# EAGLE design ULA_Replacement (EAGLE 9.7.0)
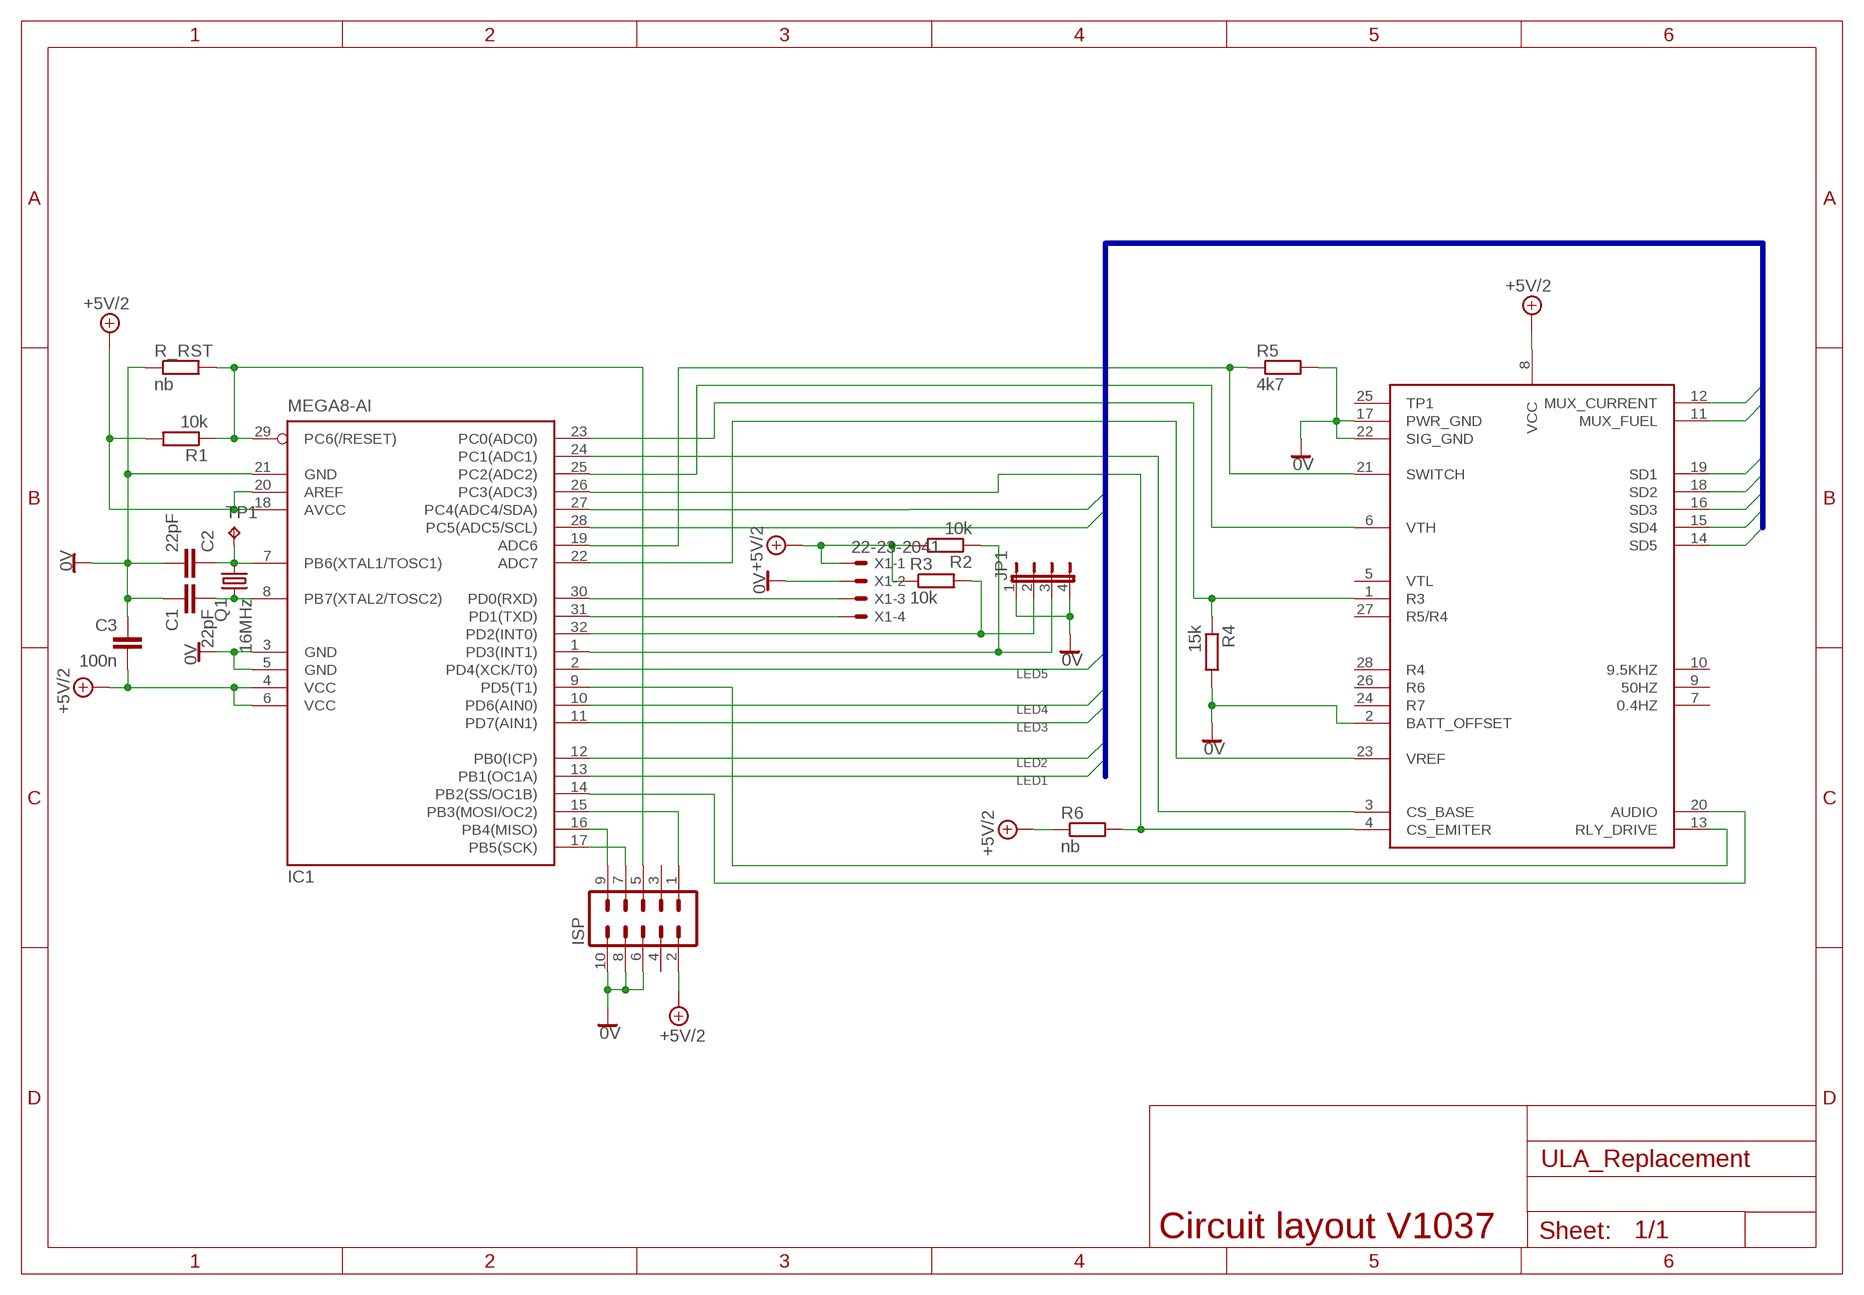
[diagram p0: schematic, sheet 1]

## Parts
C1  22pF  C-EUC0805  [C0805]
C2  22pF  C-EUC0805  [C0805]
C3  100n  C-EUC0805  [C0805]
IC1  MEGA8-AI  [TQFP32-08]
ISP  ML10  [ML10]
JP1  JP4E  [JP4]
Q1  16MHz  CRYSTALHC49S  [HC49/S]
R1  10k  R-EU_M0805  [M0805]
R2  10k  R-EU_M0805  [M0805]
R3  10k  R-EU_M0805  [M0805]
R4  15k  R-EU_M0805  [M0805]
R5  4k7  R-EU_M0805  [M0805]
R6  nb  R-EU_M0805  [M0805]
R_RST  nb  R-EU_0204/2V  [0204V]
TP1  TPB1,27  [B1,27]
U$1  C5_ULA  [C5_ULA]
X1  22-23-2041  [22-23-2041]

## Nets
+5V/2: C3.2 IC1.4(VCC) IC1.6(VCC) IC1.18(AVCC) IC1.20(AREF) ISP.2 R1.2 R2.2 R3.1 R6.1 U$1.8(VCC) X1.1
/RESET: IC1.29(PC6(/RESET)) ISP.5 R1.1 R_RST.2
AUDIO: IC1.14(PB2(SS/OC1B)) U$1.20(AUDIO)
CS_BASE: IC1.24(PC1(ADC1)) U$1.3(CS_BASE)
CS_EMITER: IC1.26(PC3(ADC3)) R6.2 U$1.4(CS_EMITER)
GND: C1.1 C2.2 C3.1 IC1.3(GND) IC1.5(GND) IC1.21(GND) ISP.6 ISP.8 ISP.10 JP1.1 JP1.4 R4.2 R5.2 R_RST.1 U$1.2(BATT_OFFSET) U$1.17(PWR_GND) U$1.22(SIG_GND) X1.2 ; supply symbol labelled 0V
INT0: IC1.32(PD2(INT0)) JP1.2 R3.2
INT1: IC1.1(PD3(INT1)) JP1.3 R2.1
LED1: IC1.13(PB1(OC1A)) U$1.19(SD1)
LED2: IC1.12(PB0(ICP)) U$1.18(SD2)
LED3: IC1.11(PD7(AIN1)) U$1.16(SD3)
LED4: IC1.10(PD6(AIN0)) U$1.15(SD4)
LED5: IC1.2(PD4(XCK/T0)) U$1.14(SD5)
MISO: IC1.16(PB4(MISO)) ISP.9
MOSI: IC1.15(PB3(MOSI/OC2)) ISP.1
MX_CURRENT: IC1.28(PC5(ADC5/SCL)) U$1.12(MUX_CURRENT)
MX_FUEL: IC1.27(PC4(ADC4/SDA)) U$1.11(MUX_FUEL)
R3: IC1.23(PC0(ADC0)) R4.1 U$1.1(R3)
RLY_DRIVE: IC1.9(PD5(T1)) U$1.13(RLY_DRIVE)
RXD: IC1.30(PD0(RXD)) X1.3
SCK: IC1.17(PB5(SCK)) ISP.7
SWITCH: IC1.19(ADC6) R5.1 U$1.21(SWITCH)
TXD: IC1.31(PD1(TXD)) X1.4
VREF: IC1.22(ADC7) U$1.23(VREF)
VTH: IC1.25(PC2(ADC2)) U$1.6(VTH)
XTAL1: C2.1 IC1.7(PB6(XTAL1/TOSC1)) Q1.1 TP1.TP
XTAL2: C1.2 IC1.8(PB7(XTAL2/TOSC2)) Q1.2
Unconnected: ISP.3 ISP.4 U$1.5(VTL) U$1.7(0.4HZ) U$1.9(50HZ) U$1.10(9.5KHZ) U$1.24(R7) U$1.25(TP1) U$1.26(R6) U$1.27(R5/R4) U$1.28(R4)

## Buses
MX_FUEL,MX_CURRENT,LED1,LED2,LED3,LED4,LED5

## Notes on the sheet
- Circuit layout V1037

## Library data of the parts
C1-C3 = rcl:C-EU: CAPACITOR, European symbol
IC1 = atmel:MEGA8: MICROCONTROLLER 8 Kbytes FLASH, 1 kbytes SRAM, 512 bytes EEPROM, USART, 6-channel 10 bit ADC, 2-channel 8 bit ADC Pin compatible with Atmega48, ATMega88, ATMega168 Source: avr.lbr
ISP = con-harting-ml:ML10: HARTING
JP1 = jumper:JP4E: JUMPER
Q1 = crystal:CRYSTAL: CRYSTAL
R1-R6 R_RST = rcl:R-EU_: RESISTOR, European symbol
TP1 = testpad:TP: Test pad
U$1 = c5_ula:C5_ULA: Sinclair C5 ULA chip
X1 = con-molex:22-23-2041: .100" (2.54mm) Center Header - 4 Pin

## Board
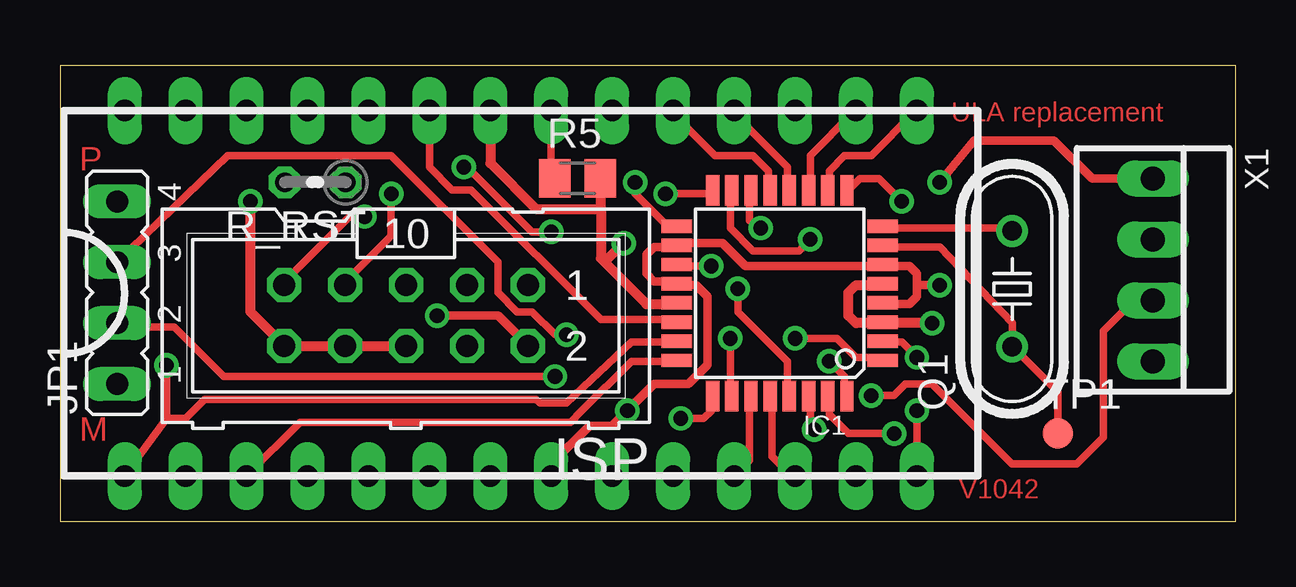
[diagram p1: board, top side]
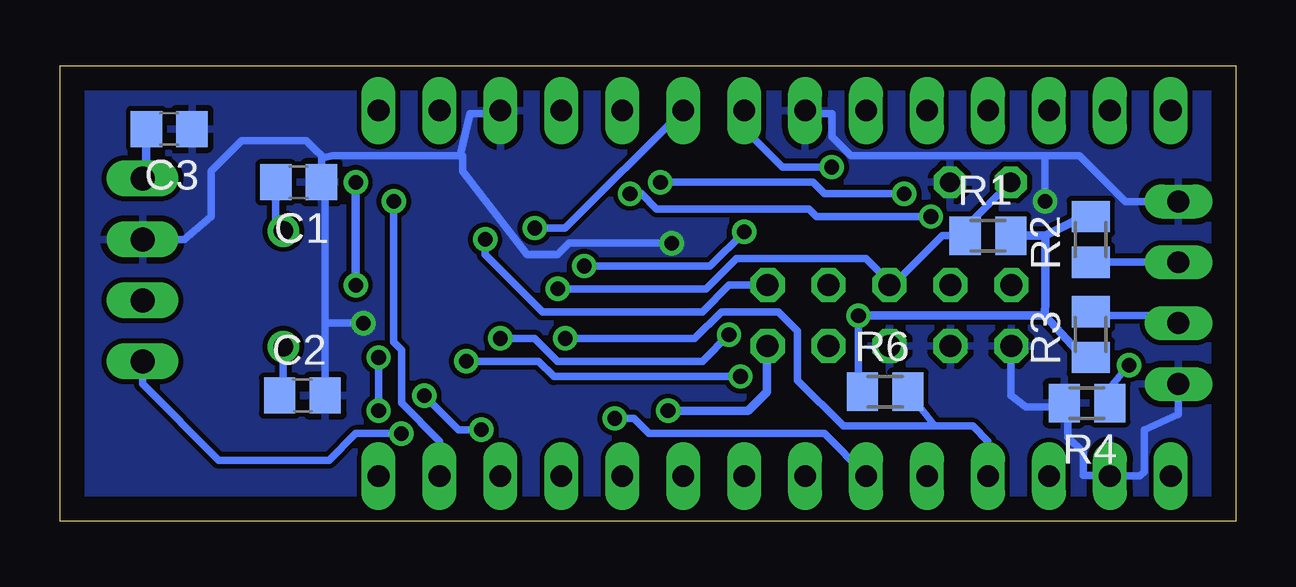
[diagram p2: board, bottom side, seen from below]

Size 49 x 19 mm. Coordinates in mm from the lower left corner, seen from the top.
Outline: 49,0 49,19 0,19 0,0 49,0
Copper layers (1*16): Top 0.035mm / dielectric 1.5mm / Bottom 0.035mm
Design rules "Fusion Electronics Design Rules": minimum track width 12mil, minimum drill 24mil, track to track 8mil, track to pad 8mil, pad to pad 8mil, via to via 8mil, smd to smd 8mil, copper to edge 40mil, drill to drill 8mil, minimum pad ring 10mil, minimum via ring 8mil, stop-mask expansion 4mil, vias tented up to drill 0mil, thermal gap 10mil

### Footprints (pad centres in the part's own frame; a part is rotated, then mirrored left to right if it is on the bottom)
C0805 = smd 1.3 x 1.5: 1 -0.95,0; 2 0.95,0
TQFP32-08 = smd 1.27 x 0.559: 1 -4.293,2.8; 2 -4.293,2; 3 -4.293,1.2; 4 -4.293,0.4; 5 -4.293,-0.4; 6 -4.293,-1.2; 7 -4.293,-2; 8 -4.293,-2.8; 17 4.293,-2.8; 18 4.293,-2; 19 4.293,-1.2; 20 4.293,-0.4; 21 4.293,0.4; 22 4.293,1.2; 23 4.293,2; 24 4.293,2.8 | smd 0.559 x 1.27: 9 -2.8,-4.293; 10 -2,-4.293; 11 -1.2,-4.293; 12 -0.4,-4.293; 13 0.4,-4.293; 14 1.2,-4.293; 15 2,-4.293; 16 2.8,-4.293; 25 2.8,4.293; 26 2,4.293; 27 1.2,4.293; 28 0.4,4.293; 29 -0.4,4.293; 30 -1.2,4.293; 31 -2,4.293; 32 -2.8,4.293
ML10 = drill 0.914 octagon: 1 -5.08,-1.27; 2 -5.08,1.27; 3 -2.54,-1.27; 4 -2.54,1.27; 5 0,-1.27; 6 0,1.27; 7 2.54,-1.27; 8 2.54,1.27; 9 5.08,-1.27; 10 5.08,1.27
JP4 = drill 0.914 long: 1 -3.81,0; 2 -1.27,0; 3 1.27,0; 4 3.81,0
HC49/S = drill 0.813: 1 -2.413,0; 2 2.413,0
M0805 = smd 1.3 x 1.6: 1 -0.95,0; 2 0.95,0
0204V = drill 0.813 octagon: 1 -1.27,0; 2 1.27,0
B1,27 = smd 1.27 x 1.27: TP 0,0
C5_ULA = drill 0.9 long: 1 -7.62,16.51; 2 -7.62,13.97; 3 -7.62,11.43; 4 -7.62,8.89; 5 -7.62,6.35; 6 -7.62,3.81; 7 -7.62,1.27; 8 -7.62,-1.27; 9 -7.62,-3.81; 10 -7.62,-6.35; 11 -7.62,-8.89; 12 -7.62,-11.43; 13 -7.62,-13.97; 14 -7.62,-16.51; 15 7.62,-16.51; 16 7.62,-13.97; 17 7.62,-11.43; 18 7.62,-8.89; 19 7.62,-6.35; 20 7.62,-3.81; 21 7.62,-1.27; 22 7.62,1.27; 23 7.62,3.81; 24 7.62,6.35; 25 7.62,8.89; 26 7.62,11.43; 27 7.62,13.97; 28 7.62,16.51
22-23-2041 = drill 1 long: 1 -3.81,0; 2 -1.27,0; 3 1.27,0; 4 3.81,0

### Placement (x,y rotation side)
C1  39.05,14.13 180 bottom
C2  38.89,5.24 0 bottom
C3  44.45,16.35 180 bottom
IC1  30,9.5 180 top
ISP  14.42,8.57 180 top
JP1  2.38,9.53 90 top
Q1  39.69,9.68 90 top
R1  10.32,11.91 0 bottom
R2  6.03,11.75 90 bottom
R3  6.03,7.78 90 bottom
R4  6.19,4.92 180 bottom
R5  21.57,14.29 0 top
R6  14.6,5.4 0 bottom
R_RST  10.64,14.13 180 top
TP1  41.59,3.65 0 top
U$1  19.21,9.5 90 top
X1  45.56,10.48 270 top

### Tracks (layer width: path | path; a pad name or v marks a point on that pad's centre or on a via)
+5V/2  (via drill 0.61)
  Top 0.305: 34.45,9.05 IC1.4 | 34.45,10.64 IC1.6 34.29,10.64 | 25.56,10 IC1.20 25.72,9.84 | 25.56,11.43 IC1.18 25.72,11.59 | v23.65,4.6 23.57,4.52 | X1.1
  Top 0.356: 34.45,9.05 35.4,9.05 35.72,9.37 35.72,9.84 | 35.72,9.84 35.72,10.32 35.4,10.64 34.45,10.64 | 25.56,10 24.77,10 24.45,10.32 24.45,11.11 24.77,11.43 25.56,11.43 | 34.29,10.64 28.57,10.64 27.62,11.59 25.72,11.59 | 25.72,9.84 26.51,9.84 26.99,9.37 26.99,6.82 26.99,6.51 26.2,5.72 26.04,5.71 24.77,5.71 23.57,4.52 23.02,3.97 22.07,3.97 20.48,2.38 U$1.8 | v36.67,14.13 38.1,15.88 41.27,15.88 41.43,15.88 43.02,14.29 45.4,14.29 X1.1 | 35.72,9.84 v36.67,9.84 | v15.72,8.57 18.26,8.57 19.37,7.46 ISP.2
  Bottom 0.305: 6.19,6.99 R3.1 6.25,6.86 6.4,6.86 6.35,6.83 | R1.2 | 6.67,12.54 6.19,12.54 R2.2 | R6.1 15.72,5.56 v15.72,8.57
  Bottom 0.356: R1.2 8.97,11.99 8.89,11.91 7.94,11.91 | 19.53,7.3 19.53,5.4 20.32,4.6 v23.65,4.6 | v36.67,9.84 v36.67,14.13 | 7.94,8.57 v15.72,8.57 | 6.35,6.83 7.94,8.57 | 7.94,11.91 6.67,12.54 | 7.94,11.91 7.94,9.21 7.94,8.57 | X1.1 45.4,14.61 45.4,15.72 C3.2
  Bottom 0.406: ISP.2 19.53,7.3
/RESET  (via drill 0.61)
  Top 0.305: v28.26,9.68 28.26,8.73 30.32,6.67 30.32,5.24 IC1.29
  Bottom 0.305: v28.26,9.68 22.07,9.68 20.8,10.95 15.4,10.95 14.45,10 ISP.5 14.29,9.84 12.22,11.91 R1.1 11.27,12.22 R_RST.2
  Bottom 0.406: R1.1 11.27,12.23
AUDIO  (via drill 0.61)
  Top 0.305: v29.21,12.22 28.73,12.54 28.73,13.65 IC1.14
  Bottom 0.305: v29.21,12.22 27.94,12.22 23.02,17.14 U$1.20
CS_BASE
  Top 0.305: 21.75,4.6 23.81,6.67 25.56,6.67 IC1.24 | 21.75,4.6 | 21.75,4.6 21.27,4.13 10,4.13 7.78,1.91 U$1.3
CS_EMITER  (via drill 0.61)
  Top 0.305: v27.94,7.62 27.94,5.24 IC1.26
  Bottom 0.305: v27.94,7.62 22.54,7.62 21.43,8.73 19.05,8.73 18.26,7.94 18.26,5.87 16.35,3.97 12.54,3.97 | 12.54,3.97 10.95,3.97 10.32,3.33 10.32,2.38 10.64,1.91 10.32,1.91 U$1.4 | 12.54,3.97 R6.2
GND  (via drill 0.61)
  Top 0.305: 34.29,8.26 IC1.3 34.45,8.26 | 34.29,9.84 IC1.5 | 9.37,7.3 ISP.10 9.21,7.46 | 11.75,7.3 ISP.8 11.91,7.3 | 14.29,7.3 ISP.6 | 22.54,14.13 R5.2 | 9.21,7.46 | IC1.21 25.56,9.21 25.56,9.05
  Top 0.406: 34.29,8.26 33.18,8.26 32.86,8.57 32.86,9.53 33.18,9.84 34.29,9.84 | v36.35,8.26 34.45,8.26 | 9.37,7.3 11.75,7.3 | 11.91,7.3 14.29,7.3 | 25.56,9.05 24.45,9.05 22.7,10.79 | 22.7,10.79 22.54,10.95 22.54,13.02 | 22.54,13.02 22.54,14.13 | 22.54,13.02 19.84,13.02 17.94,14.92 U$1.22 | 9.21,7.46 7.94,8.73 v7.94,13.34 | 22.7,10.79 v23.5,11.59
  Bottom 0.305: 38.26,14.29 37.94,14.45 38.1,14.61 38.1,15.16 38.02,15.16 | 38.26,14.29 38.1,14.29 C1.1 | 38.02,15.16 37.62,15.24 32.38,15.24 32.31,15.32 | 32.31,15.32 31.91,16.99 30.64,16.99 U$1.17 | 38.26,14.29 37.94,13.65 37.94,8.26 | 37.94,8.26 37.94,6.83 37.94,5.71 C2.2 | 37.94,8.26 v36.35,8.26 | 45.72,11.75 43.81,11.75 42.7,12.7 42.7,14.61 41.43,15.88 38.73,15.88 38.42,15.56 38.02,15.16 | 38.02,15.16 | JP1.1 2.38,4.45 3.81,3.81 3.81,2.06 3.99,1.88 U$1.2 5.24,1.91 6.35,1.91 6.35,2.86 6.99,3.49 6.99,3.65 6.99,4.6 R4.2 7.14,4.76 8.73,4.76 9.37,5.24 9.37,7.3 ISP.10 | JP1.4 4.6,13.34 6.51,15.24 7.94,15.24 | 7.94,15.24 16.03,15.24 16.83,16.03 16.83,16.99 17.78,16.99 U$1.22 | v7.94,13.34 7.94,15.24 | v23.5,11.59 27.78,11.59 28.26,11.11 29.53,11.11 32.23,14.61 32.23,15.24 32.31,15.32
  pour Bottom: 0.64,0.64 48.26,0.64 48.26,18.41 0.64,18.41
INT0  (via drill 0.61)
  Top 0.305: v32.07,6.67 32.7,6.03 32.7,5.24 IC1.32 | v20.64,6.03 6.83,6.03 4.76,8.1 2.38,8.1 JP1.2
  Bottom 0.305: v32.07,6.67 29.05,6.67 28.42,6.03 v20.64,6.03 | JP1.2 2.7,8.57 6.03,8.57 R3.2
INT1  (via drill 0.61)
  Top 0.305: v30.64,7.62 32.38,7.62 33.18,6.83 34.29,6.83 IC1.1 | v21.11,7.78 20.64,7.78 19.68,8.73 19.05,8.73 18.26,9.53 18.26,10.79 13.81,15.24 6.99,15.24 JP1.3
  Bottom 0.305: v30.64,7.62 29.21,7.62 28.26,6.67 22.23,6.67 v21.11,7.78 | JP1.3 R2.1
LED1
  Top 0.305: IC1.13 29.53,13.81 29.53,14.61 28.89,15.24 27.3,15.24 25.56,16.99 U$1.19
LED2
  Top 0.305: IC1.12 30.32,13.81 30.32,14.76 28.1,16.99 U$1.18
LED3
  Top 0.305: IC1.11 31.27,13.81 31.27,15.24 33.02,16.99 U$1.16
LED4
  Top 0.305: IC1.10 32.07,13.81 32.07,14.61 32.7,15.24 33.81,15.24 35.56,16.99 U$1.15
LED5  (via drill 0.61)
  Top 0.305: v35.72,6.83 35.08,7.46 34.45,7.46 IC1.2 | U$1.14 v35.72,4.6
  Bottom 0.305: v35.72,4.6 v35.72,6.83
MISO  (via drill 0.61)
  Top 0.305: v25.24,13.65 27.15,13.65 IC1.16 | v12.7,12.7 12.06,12.7 9.37,10 ISP.9
  Bottom 0.305: v25.24,13.65 24.77,13.65 24.13,13.02 17.78,13.02 17.46,12.7 v12.7,12.7
MOSI  (via drill 0.61)
  Top 0.305: v31.27,11.75 30.8,11.27 28.89,11.27 27.94,12.22 27.94,12.54 27.94,12.86 27.94,13.65 IC1.15
  Bottom 0.305: v31.27,11.75 31.27,11.11 28.89,8.73 22.23,8.73 21.11,9.84 19.53,9.84 ISP.1
MX_CURRENT
  Top 0.305: IC1.28 29.69,5.08 29.69,2.7 30.48,1.91 U$1.12
MX_FUEL
  Top 0.305: IC1.27 28.73,5.08 28.73,2.54 28.1,1.91 U$1.11
R3  (via drill 0.61)
  Top 0.305: 4.45,4.29 5.24,4.29 6.03,5.08 19.84,5.08 20,4.92 21.11,4.92 23.81,7.46 25.56,7.46 IC1.23 | 4.45,4.29 2.7,1.91 U$1.1 | 4.45,4.29 v4.45,6.51
  Bottom 0.305: v4.45,6.51 5.24,5.56 5.24,4.76 R4.1
RLY_DRIVE  (via drill 0.61)
  Top 0.305: v35.08,13.34 34.13,14.29 33.34,14.29 32.86,13.81 IC1.9
  Bottom 0.305: v35.08,13.34 35.08,7.46 34.77,7.14 34.77,4.92 33.18,3.33 U$1.13
RXD  (via drill 0.61)
  Top 0.305: v31.43,3.81 31.27,3.97 31.27,5.08 IC1.30 | v33.81,5.24 34.77,5.24 35.24,5.71 36.35,5.71 39.69,2.38 42.39,2.38 43.5,3.49 43.5,7.94 44.77,9.21 X1.3
  Bottom 0.305: v31.43,3.81 32.38,3.81 v33.81,5.24
SCK  (via drill 0.61)
  Top 0.305: v23.97,14.13 23.97,13.65 25.24,12.38 25.56,12.38 IC1.17 | v13.81,13.65 13.81,11.91 13.65,11.75 11.91,10 ISP.7
  Bottom 0.305: v23.97,14.13 17.62,14.13 17.14,13.65 v13.81,13.65
SWITCH  (via drill 0.61)
  Top 0.305: v27.15,10.64 25.72,10.64 IC1.19 | v20.48,12.06 19.68,12.06 17.14,14.61 16.99,14.76 v16.83,14.76 | R5.1 20.48,14.29 U$1.21
  Bottom 0.305: v27.15,10.64 21.91,10.64 v20.48,12.06 | v16.83,14.76 18.89,14.76 | 18.89,14.76 | 18.89,14.76 20.32,16.19 20.32,16.99 U$1.21
TXD  (via drill 0.61)
  Top 0.305: v34.77,3.65 32.86,3.65 32.07,4.45 32.07,5.08 IC1.31
  Bottom 0.305: v34.77,3.65 36.67,3.65 37.78,2.54 42.39,2.54 45.56,5.71 X1.4
VREF
  Top 0.305: IC1.22 25.56,8.41 22.54,8.41 17.14,13.81 16.35,13.81 15.4,14.76 U$1.23
VTH  (via drill 0.61)
  Top 0.305: v25.88,4.29 26.83,4.29 27.15,4.6 27.15,5.08 IC1.25
  Bottom 0.305: v25.88,4.29 25.08,4.29 24.45,3.65 17.14,3.65 15.4,1.91 U$1.6
XTAL1
  Top 0.305: IC1.7 34.45,11.43 36.67,11.43 39.69,8.26 Q1.1 39.85,7.14 41.59,5.4 41.59,4.45 TP1.TP
  Bottom 0.305: C2.1 39.69,5.24 Q1.1
XTAL2
  Top 0.305: IC1.8 34.45,12.22 39.37,12.22 Q1.2
  Bottom 0.305: C1.2 40.01,12.54 | Q1.2 40.01,12.54 | 40.01,12.54

### Text on the board
Top: ULA replacement | P | M | V1042
tDocu: VREF | GND | SWITCH | AUDIO | LED1 | LED2 | GND | LED3 | LED4 | R3 | BATT | BASE | EMITTER | VTH | 5V2 | MUX_V | MUX_C | RELAY | LED5